# Altium schematic sheet 6.Connectors.SchDoc
size A4; DocumentNumber: 6; SheetNumber: 6
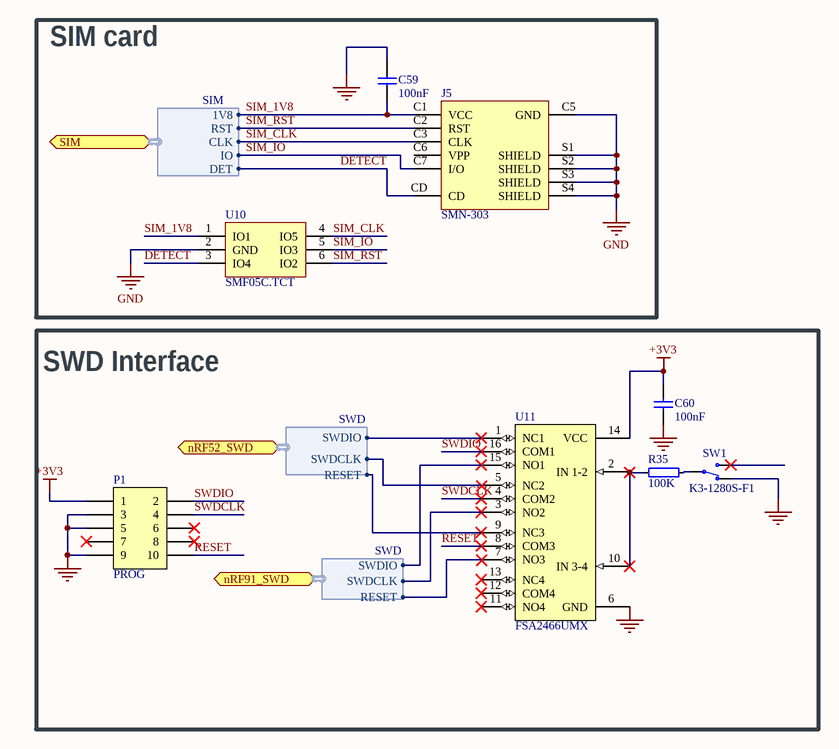
[diagram p0: 6.Connectors.SchDoc]

## Parts
C59  100nF  [CAPC1608X06L_3]
C60  100nF  [CAPC1608X06L_3]
J5  SMN-303  [XUNPU_SMN-303]
P1  PROG  [Header_SMT_2X5-1.27mm]
R35  100K  [RESC1005X04L]
SW1  K3-1280S-F1  [K3-1280S-F1]
U10  SMF05C.TCT  [SOT65P210X110-6N]
U11  FSA2466UMX  [XQFN40P180X260X50-16N]

## Blocks framed on the sheet
SIM card: C59 J5 U10
SWD Interface: C60 P1 R35 SW1 U11

## Ports
nRF52_SWD (bidir, harness SWD), nRF91_SWD (bidir, harness SWD), SIM (bidir, harness SIM)

## Harnesses
SIM: DET, RST, CLK, IO, 1V8
SWD: SWDIO, SWDCLK, RESET

## Nets
+3V3: C60.1 P1.1 U11.14(VCC)
GND: C59.1 C60.2 J5.C5(GND) J5.S1(SHIELD) J5.S2(SHIELD) J5.S3(SHIELD) J5.S4(SHIELD) P1.3 P1.5 P1.9 SW1.1(N.C) U10.2(GND) U11.6(GND)
DETECT: J5.CD U10.3(IO4) ; port SIM.DET
RESET: P1.10 U11.8(COM3)
SIM_1V8: C59.2 J5.C1(VCC) U10.1(IO1) ; port SIM.1V8
SIM_CLK: J5.C3(CLK) U10.4(IO5) ; port SIM.CLK
SIM_IO: J5.C7(I/O) U10.5(IO3) ; port SIM.IO
SIM_RST: J5.C2(RST) U10.6(IO2) ; port SIM.RST
SWDCLK: P1.4 U11.4(COM2)
SWDIO: P1.2 U11.16(COM1)
NetR35_1: R35.1 SW1.2(COM)
NetR35_2: R35.2 U11.2(IN_1-2) U11.10(IN_3-4)
NetU11_1: U11.1(NC1) ; port nRF52_SWD.SWDIO
NetU11_3: U11.3(NO2) ; port nRF91_SWD.SWDCLK
NetU11_5: U11.5(NC2) ; port nRF52_SWD.SWDCLK
NetU11_7: U11.7(NO3) ; port nRF91_SWD.RESET
NetU11_9: U11.9(NC3) ; port nRF52_SWD.RESET
NetU11_15: U11.15(NO1) ; port nRF91_SWD.SWDIO

Not connected (* = marked no-connect by the designer): J5 C6(VPP); P1 6* 7* 8*; SW1 3(N.O)*; U11 11(NO4)* 12(COM4)* 13(NC4)*

## Library data of the parts
C59 C60 = C0201-15p: Capacitor, NP0, ±5%, 25V; ComponentLink1URL: N.A.; ComponentLink1Description: Datasheet; ComponentLink2URL: N.A.; ComponentLink2Description: Supplier link; Package: 0603; LCSC: C14663
J5 = SMN-303: NanoSIM SMD SIM Card Connectors; Manufacturer: XUNPU; Alternate Part Number: SIM8066-6-1-14-01-A; Manufacturer Part Number: SMN-303; Supplier 1: LCSC; LCSC: C266888
P1 = Pin Header 2x5 SMD, 1.27mm, Angled: Pin Header 2x5, 1.27mm (50mil); Manufacturer: W-CON; Manufacturer Part Number: 1325B-1205S0Z080CR02; Part number IPS: 00000007800; Note: N.A.; Pad Count: 10; Part Number: Pin Header 2x5 SMD, 1.27mm, Angled; LatestRevisionDate: 2019-11-20; Published: 2014-01-22; Value: Pin Header 2x5; Artikkelnr Noca: N.A.; Footprint Doc: HDR_2x5-SMD-1.27mm-ANG; ComponentLink1URL: N.A.; ComponentLink1Description: Datasheet; ComponentLink2URL: N.A.; ComponentLink2Description: Supplier link; HelpURL: \\hizz\pro\app9717\Datasheet\connectors\W-CON\1325B-12XXXXZXXXCXXX.pdf; Supplier 1: Cabcon; Supplier Part Number 1: 1325B-1205S0Z080CR02; Supplier 2: Samtec; Supplier Part Number 2: FTSH-105-01-L-DH-A-C-TR; Component Class: Connectors; PartId: 100500257; LCSC: C5160761
R35 = R0201-10k: Resistor, ±1%, 0.05W; ComponentLink1URL: N.A.; ComponentLink1Description: Datasheet; ComponentLink2URL: N.A.; ComponentLink2Description: Supplier link; LCSC: C25741; Package: 0402
SW1 = AYZ0102AGRLC: Miniature slide switch, SPDT, Right-Angle, ON-ON, 12V, 100mA; ComponentLink1URL: https://www.ckswitches.com/media/1431/ayz.pdf; ComponentLink1Description: Datasheet; ComponentLink2URL: N.A.; ComponentLink2Description: Supplier link; Digikey Part Number: 401-2012-1-ND; LCSC: C92658
U10 = SMF05C.TCT: TVS DIODE 5VWM 12.5VC SC70-6; Manufacturer: Semtech; Direction: Unidirectional; Capacitance: 130pF; Reverse Breakdown Voltage: 6V; Number of Elements: 5; Element Configuration: Common Anode; Reverse Standoff Voltage: 5V; Clamping Voltage: 12.5V; Peak Pulse Power: 100W; Power Line Protection: No; Leakage Current: 5uA; Peak Pulse Current: 8A; Test Current: 1mA; ESD Protection: Yes; Diode Type: ZENER; Supplier 1: Digi-Key; Supplier Part Number 1: SMF05CCT-ND; Manufacturer Part Number: SMF05C.TCT; RoHS: Yes; Category: TVS Diodes; Stock 1: 164885; Pricing 1: 1=0.79000, 10=0.69300, 100=0.53130, 500=0.42000, 1000=0.33600 (USD); Mount: Surface Mount; Case/Package: SC; Number of Pins: 6; Min Operating Temperature: -55°C; Max Operating Temperature: 125°C; Packaging: Tape and Reel; Number of Channels: 5; Number of Unidirectional Channels: 5; Min Breakdown Voltage: 6V; Working Voltage: 5V; Polarity: Unidirectional; Max Reverse Leakage Current: 5uA; Max Breakdown Voltage: 6V; Voltage Rating (DC): 5V; Operating Supply Voltage: 5V; Resistor Type: Zener; Series: SMF; Clamping Voltage-Max: 12.5V; Length: 2mm; Width: 1.25mm; Height: 0.9mm; Depth: 1.25mm; Radiation Hardening: No; Lead Free: Lead Free; RoHS Compliant: Yes; ComponentLink1URL: https://datasheet.ciiva.com/338/smf05c-338385.pdf?src-supplier=Digi-Key; ComponentLink1Description: https://datasheet.ciiva.com/338/smf05c-338385.pdf?src-supplier=Digi-Key; ComponentLink2URL: https://datasheet.ciiva.com/18065/getdatasheetpartid-89007-18065142.pdf?src-supplier=Verical; ComponentLink2Description: https://datasheet.ciiva.com/18065/getdatasheetpartid-89007-18065142.pdf?src-supplier=Verical; ComponentLink3URL: https://datasheet.ciiva.com/338/smf05c-338386.pdf?src-supplier=Digi-Key; ComponentLink3Description: https://datasheet.ciiva.com/338/smf05c-338386.pdf?src-supplier=Digi-Key; ComponentLink4URL: https://datasheet.ciiva.com/338/smf05c-338387.pdf?src-supplier=Digi-Key; ComponentLink4Description: https://datasheet.ciiva.com/338/smf05c-338387.pdf?src-supplier=Digi-Key; ComponentLink5URL: https://datasheet.ciiva.com/16387/smf05c-16387308.pdf?src-supplier=Future+Electronics; ComponentLink5Description: https://datasheet.ciiva.com/16387/smf05c-16387308.pdf?src-supplier=Future+Electronics; LCSC: C85191
U11 = FSA2466UMX: Data / Audio Low-Voltage Dual DPDT Analog Switch; Manufacturer: ON Semiconductor; Part number IPS: 00000009986; Note: N.A.; Artikkelnr Noca: 15070069; Pad Count: 16; Part Number: FSA2466UMX; Manufacturer Part Number: FSA2466UMX; ComponentLink1URL: N.A.; ComponentLink1Description: Datasheet; ComponentLink2URL: N.A.; ComponentLink2Description: Supplier link; HelpURL: https://www.onsemi.com/pub/Collateral/FSA2466-D.PDF; Footprint Doc: UFQFN-16; LatestRevisionDate: 2019-05-15; Published: 2016-05-18; Value: FSA2466UMX; Supplier 1: Digi-Key; Supplier Part Number 1: FSA2466UMXCT-ND; Supplier 2: Mouser; Supplier Part Number 2: 512-FSA2466UMX; Component Class: Misc_ICs; PartId: 101900422; LCSC: C457657